# Altium schematic sheet 01_POWER .SchDoc
size A4
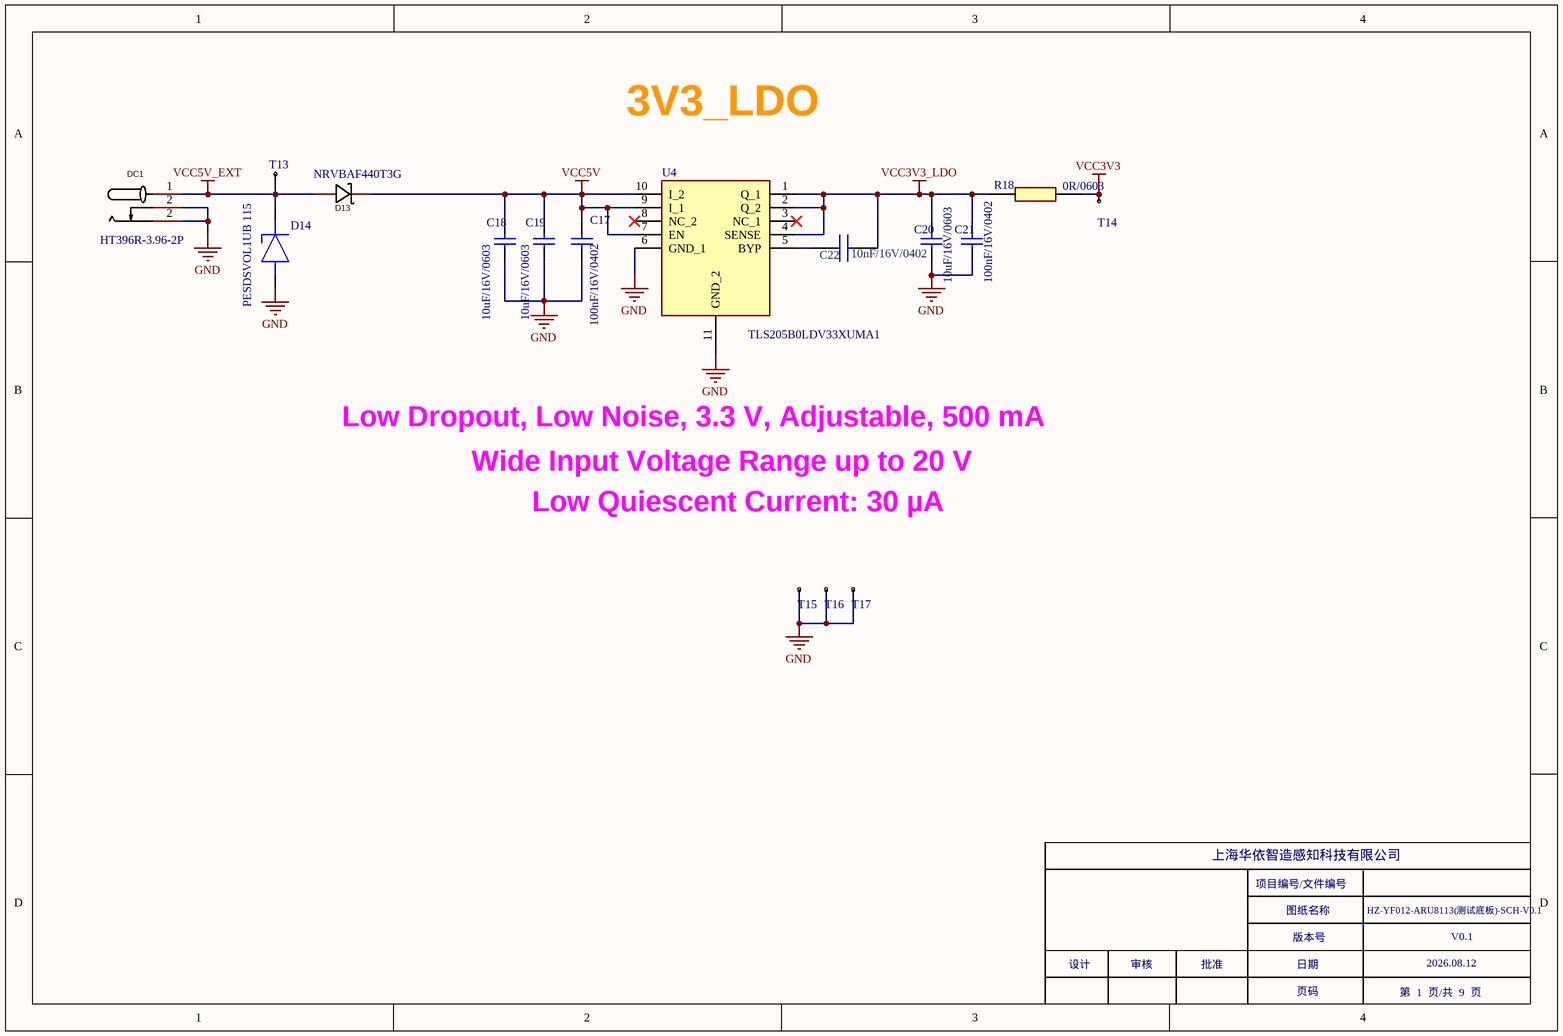
[diagram p0: 01_POWER .SchDoc]

## Parts
C17  100nF/16V/0402  [C 0402_L]
C18  10uF/16V/0603  [C 0603_L]
C19  10uF/16V/0603  [C 0603_L]
C20  10uF/16V/0603  [C 0603_L]
C21  100nF/16V/0402  [C 0402_L]
C22  10nF/16V/0402  [C 0402_L]
D13  NRVBAF440T3G  [SMA]
D14  PESDSVOL1UB 115  [SOD-523]
DC1  HT396R-3.96-2P  [HT396-3.96-2P]
R18  0R/0603  [R 0603_L]
T13  TEST  [TEST]  (value not drawn)
T14  TEST  [TEST]  (value not drawn)
T15  TEST  [TEST]  (value not drawn)
T16  TEST  [TEST]  (value not drawn)
T17  TEST  [TEST]  (value not drawn)
U4  TLS205B0LDV33XUMA1  [SON50P330X330X110-11N]

## Nets
GND: C17.2 C18.2 C19.2 C20.2 C21.2 D14.1 DC1.2 T15.1 T16.1 T17.1 U4.6(GND_1) U4.11(GND_2)
VCC3V3: R18.1 T14.1
VCC3V3_LDO: C20.1 C21.1 C22.1 R18.2 U4.1(Q_1) U4.2(Q_2) U4.4(SENSE)
VCC5V: C17.1 C18.1 C19.1 D13.2(K) U4.7(EN) U4.9(I_1) U4.10(I_2)
VCC5V_EXT: D13.1(A) D14.2 DC1.1 T13.1
NetC22_2: C22.2 U4.5(BYP)

Not connected (* = marked no-connect by the designer): U4 3(NC_1)* 8(NC_2)*

## Notes on the sheet
- 3V3_LDO
- Low Dropout, Low Noise, 3.3 V, Adjustable, 500 mA
- Wide Input Voltage Range up to 20 V
- Low Quiescent Current: 30 µA
- 上海华依智造感知科技有限公司
- 项目编号/文件编号
- 图纸名称
- HZ-YF012-ARU8113(测试底板)-SCH-V0.1
- 设计
- 审核
- 批准
- 版本号
- 日期
- 2026.08.12
- V0.1
- 页码
- 第  1  页/共  9  页

## Library data of the parts
C17 C21 = Cap: SMD/SMT 10UF 16V 20% 0603; Value: 10uF/16V; Published: 8-Jun-2000; LatestRevisionDate: 17-Jul-2002; LatestRevisionNote: Re-released for DXP Platform.; PackageReference: RAD-0.3; Publisher: Altium Limited; PackageDescription: Radial Cap, Thru-Hole; 2 Leads; 0.3 in Pin Spacing
C18-C20 = Cap: SMD/SMT 10UF 16V 20% 0603; Published: 8-Jun-2000; LatestRevisionDate: 17-Jul-2002; LatestRevisionNote: Re-released for DXP Platform.; PackageReference: RAD-0.3; Publisher: Altium Limited; PackageDescription: Radial Cap, Thru-Hole; 2 Leads; 0.3 in Pin Spacing; Value: 10uF/16V
C22 = 0402Capacitor: Capacitor; Manufacturer_Name: Murata Electronics; Manufacturer_Part_Number: GCM155R71C104KA55D; Datasheet Link: https://componentsearchengine.com//GCM155R71C104KA55D.pdf; Height: 0.55mm; Mouser2 Part Number: 81-GCM155R71C104KA5D; Mouser2 Price/Stock: https://www.mouser.com/Search/Refine.aspx?Keyword=81-GCM155R71C104KA5D
D13 = SS14_C2480: Manufacturer: MDD; Symbol: SS14; Add into BOM: yes; Diode Configuration: 独立式; Forward Voltage (Vf@If): 550mV@1A; Reverse Voltage (Vr): 40V; Average Rectified Current (Io): 1A; Reverse Leakage Current (Ir): 500uA@40V; Device: SS14_C2480; Supplier: LCSC; Manufacturer Part: SS14; Supplier Part: C2480; JLCPCB Part Class: Basic Part; LCSC Part Name: 电压:40V 电流:1A; Supplier Footprint: SMA(DO-214AC); Datasheet: https://atta.szlcsc.com/upload/public/pdf/source/20230712/2DB6064CFBB99DE6DB116BEE8208BE66.pdf; Convert to PCB: yes
D14 = PESD5V0L1UB,115: Diode ESD (Uni-directional); Manufacturer_Name: Nexperia; Datasheet Link: https://assets.nexperia.com/documents/data-sheet/PESD5V0L1UB.pdf; Height: 0.65mm; Manufacturer_Part_Number: PESD5V0L1UB,115
DC1 = DC005: Manufacturer: SHOU HAN(首韩); Symbol: DC005_C431533; Add into BOM: yes; Connector Type: DC电源插座; Inside Contact Diameter: 2mm; Outside Contact Diameter: 6.3mm; Current Rating (Max): 500mA; Voltage Rating (Max): 30V; Device: DC005; LCSC Part Name: DC电源插座 内径:2mm 外径:6.3mm; Supplier Part: C431533; Manufacturer Part: DC005; Supplier Footprint: 插件; JLCPCB Part Class: Extended Part; Datasheet: https://atta.szlcsc.com/upload/public/pdf/source/20190925/C431533_4751811035784AC1D38EBC85F7905E99.pdf; Supplier: LCSC; Convert to PCB: yes; Mounting Style: 弯插; Operating Temperature Range: -40℃~+55℃
R18 = 0402Resistor: Resistor; Manufacturer_Name: KOA Speer; Manufacturer_Part_Number: RN73H1ETTP1002F50; Datasheet Link: https://www.mouser.fr/datasheet/2/219/RN73H-12200.pdf; Height: 0.4mm
U4 = TLS205B0LDV33XUMA1: Integrated Circuit; Manufacturer_Name: Infineon; Datasheet Link: https://www.mouser.de/datasheet/2/196/Infineon-TLS203B0-DS-v01_20-EN-1149982.pdf; Height: 1.1mm; Manufacturer_Part_Number: TLS205B0LDV33XUMA1; ComponentLink1Description: New link; ComponentLink1URL: *